# Altium project RP2350_OPCUA_Node.PrjPcb (part 2 of 2)

## Sheet 09_DIGITAL_IO.SchDoc: Схема электрическая принципиальная
size 420 x 297 mm; ApprovedBy: Скрябин; CheckedBy: Скрябин; Author: Корсунов; CompanyName: РТУ МИРЭА; SheetNumber: 9; SheetTotal: 11; PageSetup: Record=PageOptions|CenterHorizontal=True|CenterVertical=True|PrintScale=0.94|XCorrection=1.00|YCorrection=1.00|PrintKind=1|BorderSize=5000000|LeftOffset=0|BottomOffset=0|Orientation=1|PaperLength=1000|PaperWidth=1000|Scale=100|PaperSource=7|PrintQuality=-4|MediaType=1|DitherType=10|PaperKind=A4|PrintScaleMode=1; DecimalNumber: RP23.000001.009 Э3; Name1: Модуль ввода-вывода; lit_A: О; Name2: RP2350 OPC UA
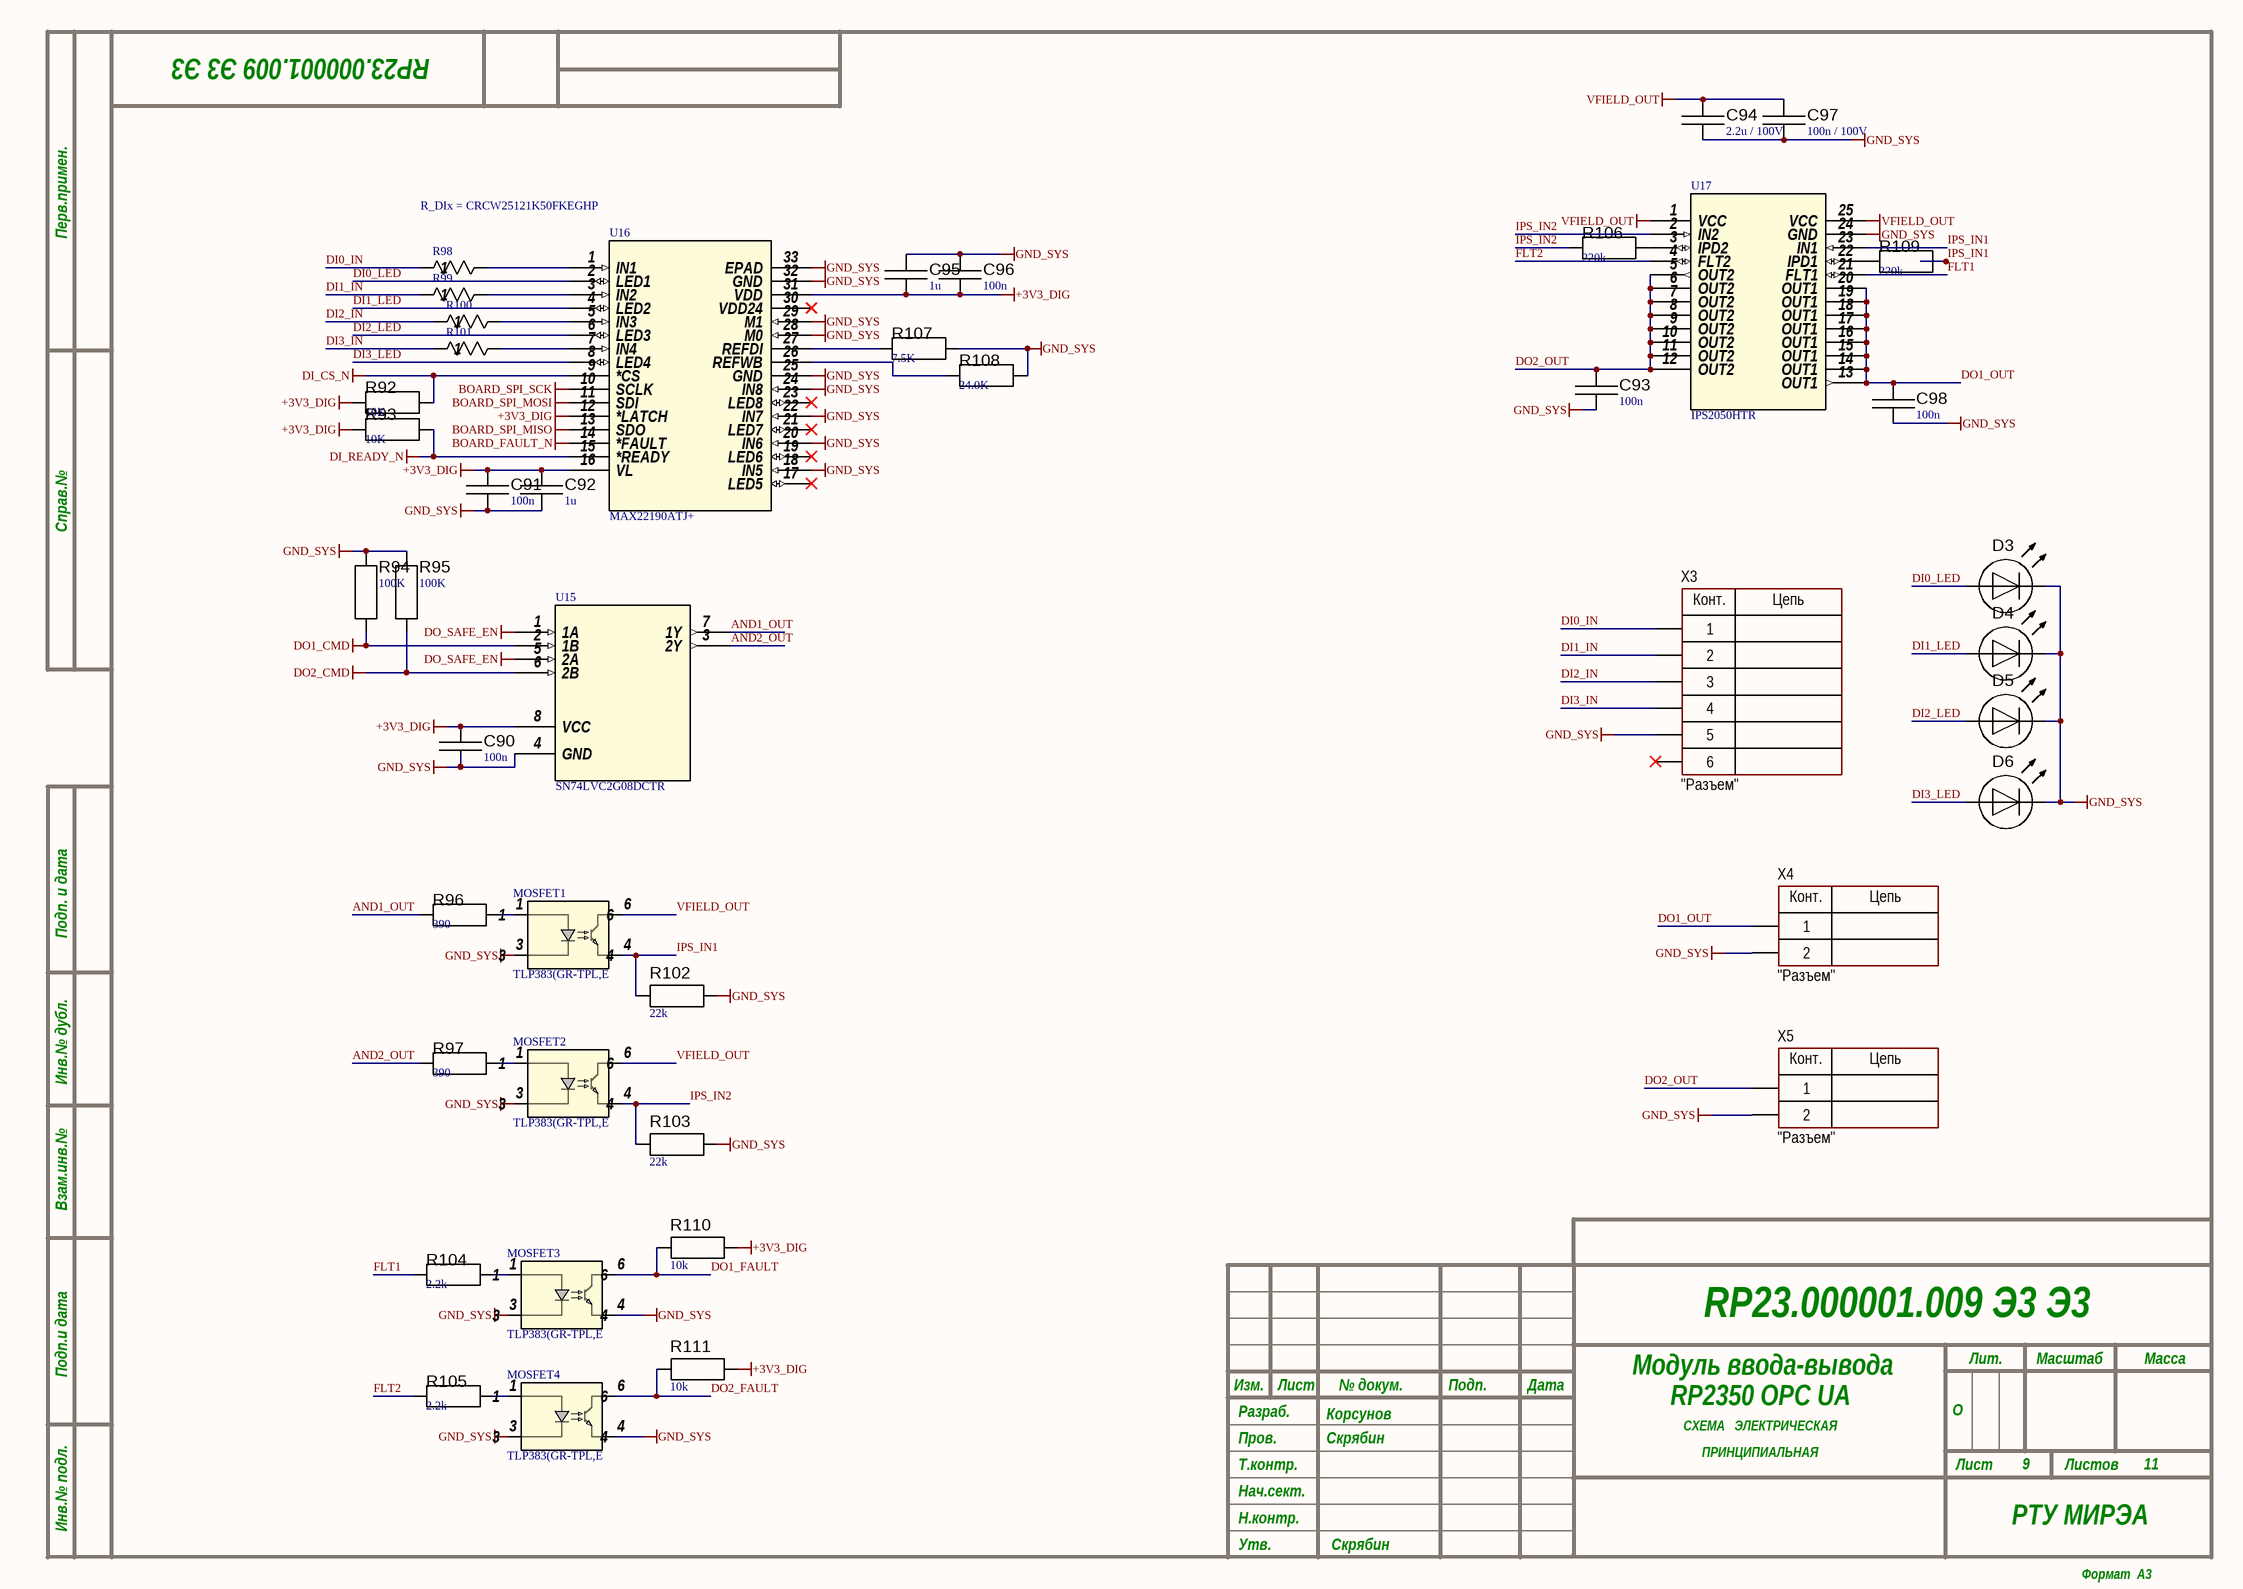
[diagram p8: 09_DIGITAL_IO.SchDoc]

### Parts
C90  value 100n  [C_0603]  (hidden comment: Capacitor)
C91  value 100n  [C_0603]  (hidden comment: Capacitor)
C92  value 1u  [C_0603]  (hidden comment: Capacitor)
C93  value 100n  [C_0603]  (hidden comment: Capacitor)
C94  value 2.2u / 100V  [C_1206]  (hidden comment: Capacitor)
C95  value 1u  [C_0603]  (hidden comment: Capacitor)
C96  value 100n  [C_0603]  (hidden comment: Capacitor)
C97  value 100n / 100V  [C_0603]  (hidden comment: Capacitor)
C98  value 100n  [C_0603]  (hidden comment: Capacitor)
D3  Light-Emitting Diode  [LED_PLCC2_3528]  (value not drawn)
D4  Light-Emitting Diode  [LED_PLCC2_3528]  (value not drawn)
D5  Light-Emitting Diode  [LED_PLCC2_3528]  (value not drawn)
D6  Light-Emitting Diode  [LED_PLCC2_3528]  (value not drawn)
MOSFET1  TLP383(GR-TPL,E  [4pin SO6L_TOS]
MOSFET2  TLP383(GR-TPL,E  [4pin SO6L_TOS]
MOSFET3  TLP383(GR-TPL,E  [4pin SO6L_TOS]
MOSFET4  TLP383(GR-TPL,E  [4pin SO6L_TOS]
R92  value 10K  [R_0603]  (hidden comment: Resistor)
R93  value 10K  [R_0603]  (hidden comment: Resistor)
R94  value 100K  [R_0603]  (hidden comment: Resistor)
R95  value 100K  [R_0603]  (hidden comment: Resistor)
R96  value 390  [R_0603]  (hidden comment: Resistor)
R97  value 390  [R_0603]  (hidden comment: Resistor)
R98  CRCW25121K50FKEGHP  [RES_0FKEGHP_VIS]  (value not drawn)
R99  CRCW25121K50FKEGHP  [RES_0FKEGHP_VIS]  (value not drawn)
R100  CRCW25121K50FKEGHP  [RES_0FKEGHP_VIS]  (value not drawn)
R101  CRCW25121K50FKEGHP  [RES_0FKEGHP_VIS]  (value not drawn)
R102  value 22k  [R_0603]  (hidden comment: Resistor)
R103  value 22k  [R_0603]  (hidden comment: Resistor)
R104  value 2.2k  [R_0603]  (hidden comment: Resistor)
R105  value 2.2k  [R_0603]  (hidden comment: Resistor)
R106  value 220k  [R_0603]  (hidden comment: Resistor)
R107  value 7.5K  [R_0603]  (hidden comment: Resistor)
R108  value 24.0K  [R_0603]  (hidden comment: Resistor)
R109  value 220k  [R_0603]  (hidden comment: Resistor)
R110  value 10k  [R_0603]  (hidden comment: Resistor)
R111  value 10k  [R_0603]  (hidden comment: Resistor)
U15  SN74LVC2G08DCTR  [DCT8]
U16  MAX22190ATJ+  [21-0140L_T3255-5_MXM]
U17  IPS2050HTR  [POWERSSO-24_STM]
X3  CommentText: "Разъем"  [CON: DG350-3.5-06P]
X4  CommentText: "Разъем"  [CON: DG350-3.5-02P]
X5  CommentText: "Разъем"  [CON: DG350-3.5-02P]

### Nets
+3V3_DIG: C90.1 C91.1 C92.1 C95.1 C96.1 R92.1 R93.1 R110.1 R111.1 U15.8(VCC) U16.12(*LATCH) U16.16(VL) U16.31(VDD)
BOARD_FAULT_N: U16.14(*FAULT)
BOARD_SPI_MISO: U16.13(SDO)
BOARD_SPI_MOSI: U16.11(SDI)
BOARD_SPI_SCK: U16.10(SCLK)
DI_CS_N: R92.2 U16.9(*CS)
DI_READY_N: R93.2 U16.15(*READY)
DO1_CMD: R94.1 U15.2(1B)
DO1_FAULT: MOSFET3.6 R110.2
DO2_CMD: R95.1 U15.6(2B)
DO2_FAULT: MOSFET4.6 R111.2
DO_SAFE_EN: U15.1(1A) U15.5(2A)
GND_SYS: C90.2 C91.2 C92.2 C93.1 C94.1 C95.2 C96.2 C97.1 C98.1 D3.2(C) D4.2(C) D5.2(C) D6.2(C) MOSFET1.3 MOSFET2.3 MOSFET3.3 MOSFET3.4 MOSFET4.3 MOSFET4.4 R94.2 R95.2 R102.1 R103.1 R107.2 R108.2 U15.4(GND) U16.18(IN5) U16.20(IN6) U16.22(IN7) U16.24(IN8) U16.25(GND) U16.28(M0) U16.29(M1) U16.32(GND) U16.33(EPAD) U17.24(GND) X3.5 X4.2 X5.2
VFIELD_OUT: C94.2 C97.2 MOSFET1.6 MOSFET2.6 U17.1(VCC) U17.25(VCC)
AND1_OUT: R96.1 U15.7(1Y)
AND2_OUT: R97.1 U15.3(2Y)
DI0_IN: R98.1 X3.1
DI0_LED: D3.1(A) U16.2(LED1)
DI1_IN: R99.1 X3.2
DI1_LED: D4.1(A) U16.4(LED2)
DI2_IN: R100.1 X3.3
DI2_LED: D5.1(A) U16.6(LED3)
DI3_IN: R101.1 X3.4
DI3_LED: D6.1(A) U16.8(LED4)
DO1_OUT: C98.2 U17.13(OUT1) U17.14(OUT1) U17.15(OUT1) U17.16(OUT1) U17.17(OUT1) U17.18(OUT1) U17.19(OUT1) U17.20(OUT1) X4.1
DO2_OUT: C93.2 U17.5(OUT2) U17.6(OUT2) U17.7(OUT2) U17.8(OUT2) U17.9(OUT2) U17.10(OUT2) U17.11(OUT2) U17.12(OUT2) X5.1
FLT1: R104.1 U17.21(FLT1)
FLT2: R105.1 U17.4(FLT2)
IPS_IN1: MOSFET1.4 R102.2 R109.2 U17.23(IN1)
IPS_IN2: MOSFET2.4 R103.2 R106.1 U17.2(IN2)
NetMOSFET1_1: MOSFET1.1 R96.2
NetMOSFET2_1: MOSFET2.1 R97.2
NetMOSFET3_1: MOSFET3.1 R104.2
NetMOSFET4_1: MOSFET4.1 R105.2
NetR98_2: R98.2 U16.1(IN1)
NetR99_2: R99.2 U16.3(IN2)
NetR100_2: R100.2 U16.5(IN3)
NetR101_2: R101.2 U16.7(IN4)
NetR106_2: R106.2 U17.3(IPD2)
NetR107_1: R107.1 U16.27(REFDI)
NetR108_1: R108.1 U16.26(REFWB)
NetR109_1: R109.1 U17.22(IPD1)

Not connected (* = marked no-connect by the designer): U16 17(LED5)* 19(LED6)* 21(LED7)* 23(LED8)* 30(VDD24)*; X3 6*

### Notes on the sheet
- R_DIx = CRCW25121K50FKEGHP
- Перв.примен.
- Справ.№
- Подп. и дата
- Инв.№ дубл.
- Взам.инв.№
- Подп.и дата
- Разраб.
- Изм.
- Лист
- № докум.
- Подп.
- Дата
- Лит.
- Масштаб
- Масса
- Т.контр.
- Пров.
- СХЕМА   ЭЛЕКТРИЧЕСКАЯ
- ПРИНЦИПИАЛЬНАЯ
- Листов
- Инв.№ подл.
- Утв.
- Н.контр.
- Нач.сект.
- Формат  A3
- (in symbol Connector_terminal_2pin) Конт.; Цепь
- (in symbol Connector_terminal_6pin) Конт.; Цепь

### Library data of the parts
C90-C98 = Capacitor: SimulationGenericComponent: True
D3-D6 = LED: AF: 1; BV: 0; BV_MAX: 1e99; EG: 1.11; FC: 0.5; IBV: 0.001; IS: 1e-14; MJSW: 0.33; NTUN: 30; TNOM: 27; XTI: 3; SimulationGenericComponent: True; CJO: 0; CJP: 0; CTA: 0; CTP: 0; FCS: 0.5; FV_MAX: 1e99; IKF: 0; IKR: 0; ISR: 1e-14; JSW: 0; JTUN: 0; JTUNSW: 0; KEG: 1; KF: 0; LEVEL: 1; N: 1; NBV: 1; NR: 1; NS: 1; PHP: 1; RS: 0; TCV: 0; TLEV: 0; TLEVC: 0; TM1: 0; TM2: 0; TPB: 0; TPHP: 0; TRS: 0; TRS2: 0; TT: 0; TTT1: 0; TTT2: 0; VJ: 1; XTITUN: 3
MOSFET1-MOSFET4 = TLP383GR-TPL,E: Photocoupler (phototransistor output), DC input, 5000 Vrms, 4pin SO6L; Manufacturer_Name: Toshiba Electronic Devices & Storage Corp.; Number_devices_in_Package: 1; Copyright: Copyright (C) 2026 Ultra Librarian. All rights reserved.; Manufacturer_Part_Number: TLP383(GR-TPL,E; Datasheet: https://toshiba.semicon-storage.com/info/docget.jsp?did=28830&prodName=TLP383; Source_Package: TLP383; RefDes: Refdes; Type: Type
R92-R97 R102-R111 = Resistor: TC1: 0; SimulationGenericComponent: True; TC2: 0
R98-R101 = CRCW25121K50FKEGHP: CRCW2512-HP 100 1K5 1% E67 E3; Manufacturer_Name: Vishay; Type: Chip Resistor - Surface Mount; Copyright: Copyright (C) 2026 Ultra Librarian. All rights reserved.; Manufacturer_Part_Number: CRCW25121K50FKEGHP; Datasheet: https://www.vishay.com/doc?20043
U15 = SN74LVC2G08DCTR: 2-ch, 2-input 1.65-V to 5.5-V 32 mA drive strength AND gate 8-SSOP -40 to 125; Manufacturer_Name: Texas Instruments; Copyright: Copyright (C) 2026 Ultra Librarian. All rights reserved.; Manufacturer_Part_Number: SN74LVC2G08DCTR; RefDes: RefDes; Type: Type
U16 = MAX22190ATJ+: Octal Industrial Digital Input with Diagnostics; Manufacturer_Name: Analog Devices Inc; Copyright: Copyright (C) 2026 Ultra Librarian. All rights reserved.; Manufacturer_Part_Number: MAX22190ATJ+; RefDes: RefDes; Type: Type
U17 = IPS2050HTR: High efficiency, high-side switch with extended diagnostics and smart driving for capacitive loads; Manufacturer_Name: STMicroelectronics; Copyright: Copyright (C) 2026 Ultra Librarian. All rights reserved.; Manufacturer_Part_Number: IPS2050HTR; Datasheet: https://www.st.com/resource/en/datasheet/ips2050h.pdf; RefDes: RefDes; Type: Type
X3 = Connector_terminal_6pin: Manufacturer: Degson; ValueManufacturerPartNumber: Terminal connector, 6pin, 3.5mm, 300VAC, 10A; PartNumber: DG350-3.5-06P-14; TypeConnector: Terminal connector; VoltageMax: 300VAC; Pitch: 3.5mm; CurrentMax: 10A; Multichannel: 6pin; HelpURL: https://www.compel.ru/infosheet/DEGSON/DG350-3.5-06P-14-00AH
X4 X5 = Connector_terminal_2pin: Manufacturer: Degson; ValueManufacturerPartNumber: Terminal connector, 2pin, 3.5mm, 300VAC, 10A; PartNumber: DG350-3.5-02P-14; TypeConnector: Terminal connector; VoltageMax: 300VAC; Pitch: 3.5mm; CurrentMax: 10A; Multichannel: 2pin; HelpURL: https://www.chipdip.ru/product/dg350-3.5-02p-12

## Sheet 10_UNIVERSAL_INPUTS.SchDoc: Схема электрическая принципиальная
size 420 x 297 mm; ApprovedBy: Скрябин; CheckedBy: Скрябин; Author: Корсунов; CompanyName: РТУ МИРЭА; SheetNumber: 10; SheetTotal: 11; PageSetup: Record=PageOptions|CenterHorizontal=True|CenterVertical=True|PrintScale=0.94|XCorrection=1.00|YCorrection=1.00|PrintKind=1|BorderSize=5000000|LeftOffset=0|BottomOffset=0|Orientation=1|PaperLength=1000|PaperWidth=1000|Scale=100|PaperSource=7|PrintQuality=-4|MediaType=1|DitherType=10|PaperKind=A4|PrintScaleMode=1; DecimalNumber: RP23.000001.010 Э3; Name1: Модуль ввода-вывода; lit_A: О; Name2: RP2350 OPC UA
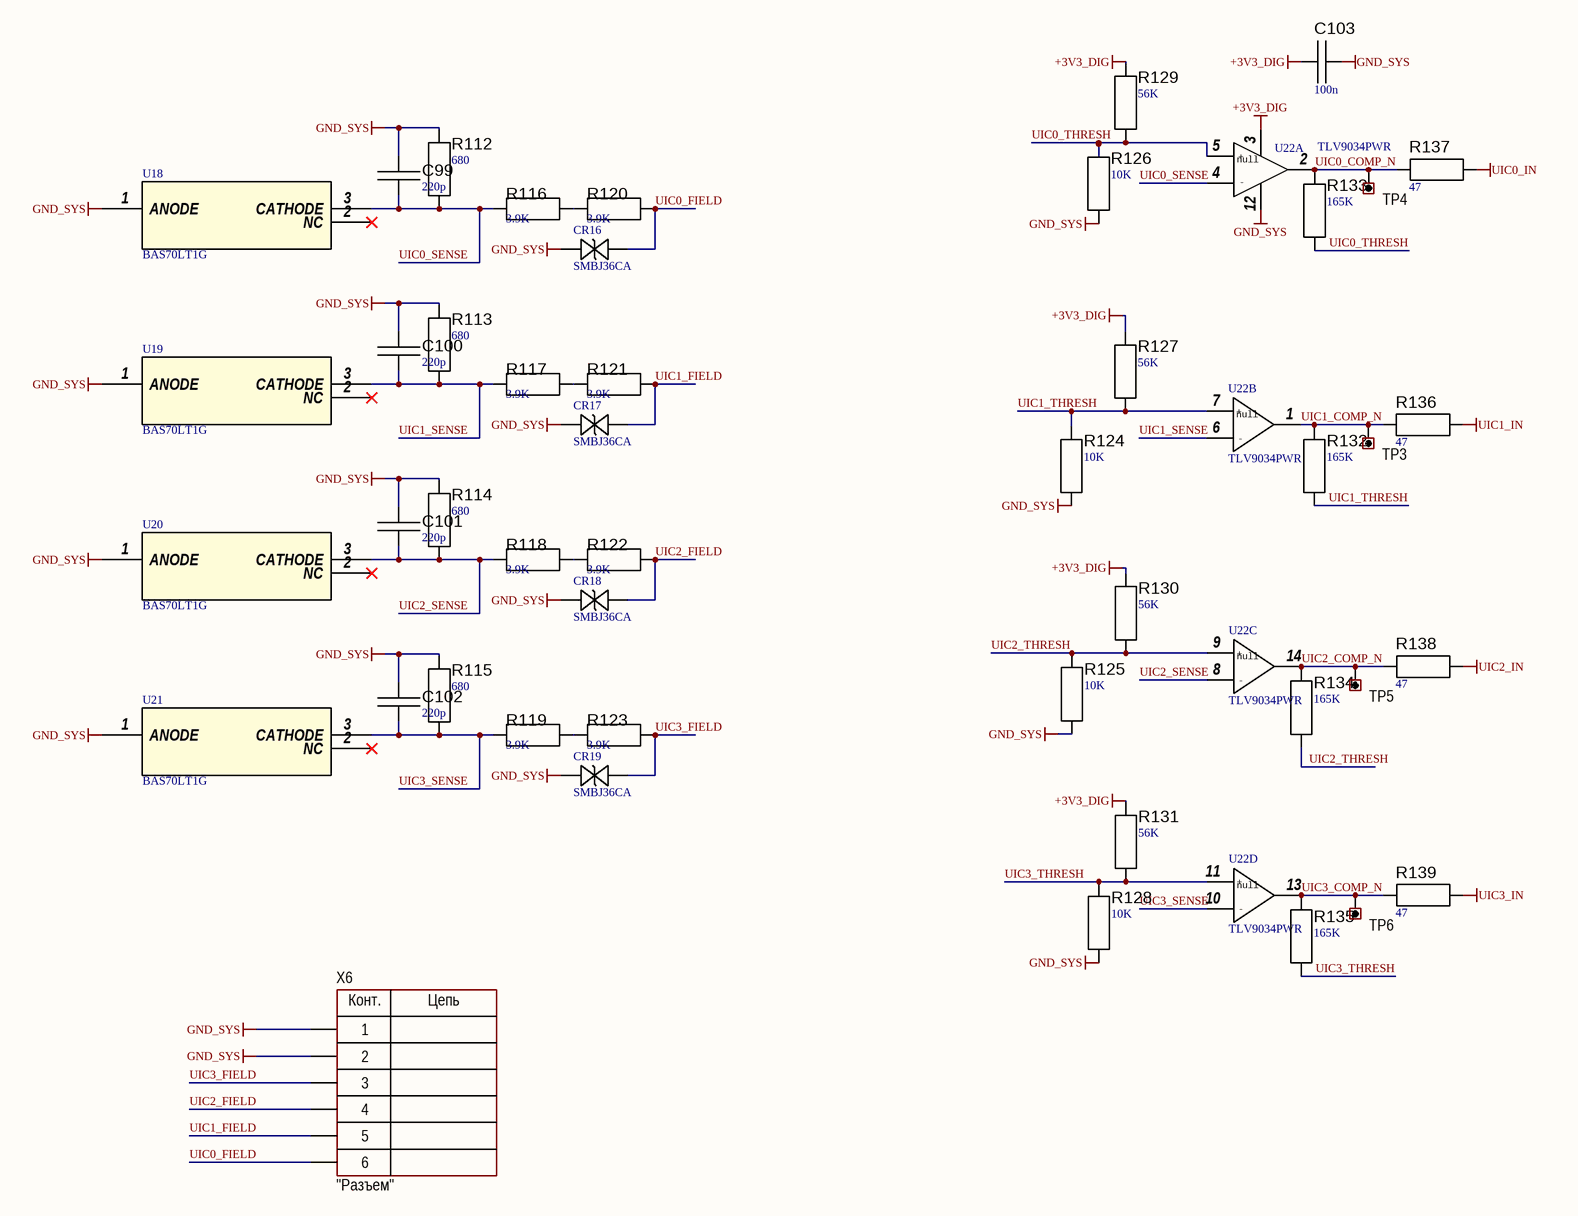
[diagram p9: 10_UNIVERSAL_INPUTS.SchDoc]

### Parts
C99  value 220p  [C_0603]  (hidden comment: Capacitor)
C100  value 220p  [C_0603]  (hidden comment: Capacitor)
C101  value 220p  [C_0603]  (hidden comment: Capacitor)
C102  value 220p  [C_0603]  (hidden comment: Capacitor)
C103  value 100n  [C_0603]  (hidden comment: Capacitor)
CR16  SMBJ36CA  [SMBJSeries_LTF]
CR17  SMBJ36CA  [SMBJSeries_LTF]
CR18  SMBJ36CA  [SMBJSeries_LTF]
CR19  SMBJ36CA  [SMBJSeries_LTF]
R112  value 680  [R_0603]  (hidden comment: Resistor)
R113  value 680  [R_0603]  (hidden comment: Resistor)
R114  value 680  [R_0603]  (hidden comment: Resistor)
R115  value 680  [R_0603]  (hidden comment: Resistor)
R116  value 3.9K  [R_0603]  (hidden comment: Resistor)
R117  value 3.9K  [R_0603]  (hidden comment: Resistor)
R118  value 3.9K  [R_0603]  (hidden comment: Resistor)
R119  value 3.9K  [R_0603]  (hidden comment: Resistor)
R120  value 3.9K  [R_0603]  (hidden comment: Resistor)
R121  value 3.9K  [R_0603]  (hidden comment: Resistor)
R122  value 3.9K  [R_0603]  (hidden comment: Resistor)
R123  value 3.9K  [R_0603]  (hidden comment: Resistor)
R124  value 10K  [R_0603]  (hidden comment: Resistor)
R125  value 10K  [R_0603]  (hidden comment: Resistor)
R126  value 10K  [R_0603]  (hidden comment: Resistor)
R127  value 56K  [R_0603]  (hidden comment: Resistor)
R128  value 10K  [R_0603]  (hidden comment: Resistor)
R129  value 56K  [R_0603]  (hidden comment: Resistor)
R130  value 56K  [R_0603]  (hidden comment: Resistor)
R131  value 56K  [R_0603]  (hidden comment: Resistor)
R132  value 165K  [R_0603]  (hidden comment: Resistor)
R133  value 165K  [R_0603]  (hidden comment: Resistor)
R134  value 165K  [R_0603]  (hidden comment: Resistor)
R135  value 165K  [R_0603]  (hidden comment: Resistor)
R136  value 47  [R_0603]  (hidden comment: Resistor)
R137  value 47  [R_0603]  (hidden comment: Resistor)
R138  value 47  [R_0603]  (hidden comment: Resistor)
R139  value 47  [R_0603]  (hidden comment: Resistor)
TP3  (no value)  [CON: 5000 (Keystone)]
TP4  (no value)  [CON: 5000 (Keystone)]
TP5  (no value)  [CON: 5000 (Keystone)]
TP6  (no value)  [CON: 5000 (Keystone)]
U18  BAS70LT1G  [SOT-23_ONS]
U19  BAS70LT1G  [SOT-23_ONS]
U20  BAS70LT1G  [SOT-23_ONS]
U21  BAS70LT1G  [SOT-23_ONS]
U22  TLV9034PWR  [PW0014A-IPC_A]  (parts A,B,C,D of 4)
X6  CommentText: "Разъем"  [CON: DG350-3.5-06P]

### Nets
+3V3_DIG: C103.2 R127.2 R129.2 R130.2 R131.2 U22.3(V+)
GND_SYS: C99.2 C100.2 C101.2 C102.2 C103.1 CR16.2 CR17.2 CR18.2 CR19.2 R112.2 R113.2 R114.2 R115.2 R124.1 R125.1 R126.1 R128.1 U18.1(ANODE) U19.1(ANODE) U20.1(ANODE) U21.1(ANODE) U22.12(V-) X6.1 X6.2
UIC0_IN: R137.1
UIC1_IN: R136.1
UIC2_IN: R138.1
UIC3_IN: R139.1
UIC0_COMP_N: R133.2 R137.2 TP4.1 U22.2(OUT1)
UIC0_FIELD: CR16.1 R120.2 X6.6
UIC0_SENSE: C99.1 R112.1 R116.1 U18.3(CATHODE) U22.4(IN1-)
UIC0_THRESH: R126.2 R129.1 R133.1 U22.5(IN1+)
UIC1_COMP_N: R132.2 R136.2 TP3.1 U22.1(OUT2)
UIC1_FIELD: CR17.1 R121.2 X6.5
UIC1_SENSE: C100.1 R113.1 R117.1 U19.3(CATHODE) U22.6(IN2-)
UIC1_THRESH: R124.2 R127.1 R132.1 U22.7(IN2+)
UIC2_COMP_N: R134.2 R138.2 TP5.1 U22.14(OUT3)
UIC2_FIELD: CR18.1 R122.2 X6.4
UIC2_SENSE: C101.1 R114.1 R118.1 U20.3(CATHODE) U22.8(IN3-)
UIC2_THRESH: R125.2 R130.1 R134.1 U22.9(IN3+)
UIC3_COMP_N: R135.2 R139.2 TP6.1 U22.13(OUT4)
UIC3_FIELD: CR19.1 R123.2 X6.3
UIC3_SENSE: C102.1 R115.1 R119.1 U21.3(CATHODE) U22.10(IN4-)
UIC3_THRESH: R128.2 R131.1 R135.1 U22.11(IN4+)
NetR116_2: R116.2 R120.1
NetR117_2: R117.2 R121.1
NetR118_2: R118.2 R122.1
NetR119_2: R119.2 R123.1

Not connected (* = marked no-connect by the designer): U18 2(NC)*; U19 2(NC)*; U20 2(NC)*; U21 2(NC)*

### Notes on the sheet
- Перв.примен.
- Справ.№
- Подп. и дата
- Инв.№ дубл.
- Взам.инв.№
- Подп.и дата
- Разраб.
- Изм.
- Лист
- № докум.
- Подп.
- Дата
- Лит.
- Масштаб
- Масса
- Т.контр.
- Пров.
- СХЕМА   ЭЛЕКТРИЧЕСКАЯ
- ПРИНЦИПИАЛЬНАЯ
- Листов
- Инв.№ подл.
- Утв.
- Н.контр.
- Нач.сект.
- Формат  A3
- (in symbol Connector_terminal_6pin) Конт.; Цепь
- (in symbol TLV9034PWR, part A) +; null; -
- (in symbol TLV9034PWR, part B) +; null; -
- (in symbol TLV9034PWR, part C) +; null; -
- (in symbol TLV9034PWR, part D) +; null; -

### Library data of the parts
C99-C103 = Capacitor: SimulationGenericComponent: True
CR16-CR19 = SMBJ36CA: No Description Available; Manufacturer_Name: Littelfuse Inc; Copyright: Copyright (C) 2026 Ultra Librarian. All rights reserved.; Manufacturer_Part_Number: SMBJ36CA
R112-R139 = Resistor: TC1: 0; SimulationGenericComponent: True; TC2: 0
TP3-TP6 = Connector_Test_Point: Manufacturer: Keystone; ValueManufacturerPartNumber: Test point, Keystone, 5001; PartNumber: 5001; TypeConnector: Test point; HelpURL: https://www.digikey.com/product-detail/en/keystone-electronics/5001/36-5001-ND/255327
U18-U21 = BAS70LT1G: No Description Available; Manufacturer_Name: onsemi; Copyright: Copyright (C) 2026 Ultra Librarian. All rights reserved.; Manufacturer_Part_Number: BAS70LT1G; RefDes: RefDes; Type: Type
U22 = TLV9034PWR: High-performance, quad low-voltage push-pull comparator 14-TSSOP -40 to 125; Manufacturer_Name: Texas Instruments; TYPE: TYPE; RefDes: RefDes; Copyright: Copyright (C) 2026 Ultra Librarian. All rights reserved.; Manufacturer_Part_Number: TLV9034PWR; Datasheet: https://www.ti.com/lit/gpn/tlv9034
X6 = Connector_terminal_6pin: Manufacturer: Degson; ValueManufacturerPartNumber: Terminal connector, 6pin, 3.5mm, 300VAC, 10A; PartNumber: DG350-3.5-06P-14; TypeConnector: Terminal connector; VoltageMax: 300VAC; Pitch: 3.5mm; CurrentMax: 10A; Multichannel: 6pin; HelpURL: https://www.compel.ru/infosheet/DEGSON/DG350-3.5-06P-14-00AH

## Sheet 11_LEDS.SchDoc: Схема электрическая принципиальная
size 420 x 297 mm; ApprovedBy: Скрябин; CheckedBy: Скрябин; Author: Корсунов; CompanyName: РТУ МИРЭА; SheetNumber: 11; SheetTotal: 11; PageSetup: Record=PageOptions|CenterHorizontal=True|CenterVertical=True|PrintScale=0.94|XCorrection=1.00|YCorrection=1.00|PrintKind=1|BorderSize=5000000|LeftOffset=0|BottomOffset=0|Orientation=1|PaperLength=1000|PaperWidth=1000|Scale=100|PaperSource=7|PrintQuality=-4|MediaType=1|DitherType=10|PaperKind=A4|PrintScaleMode=1; DecimalNumber: RP23.000001.011 Э3; Name1: Модуль ввода-вывода; lit_A: О; Name2: RP2350 OPC UA
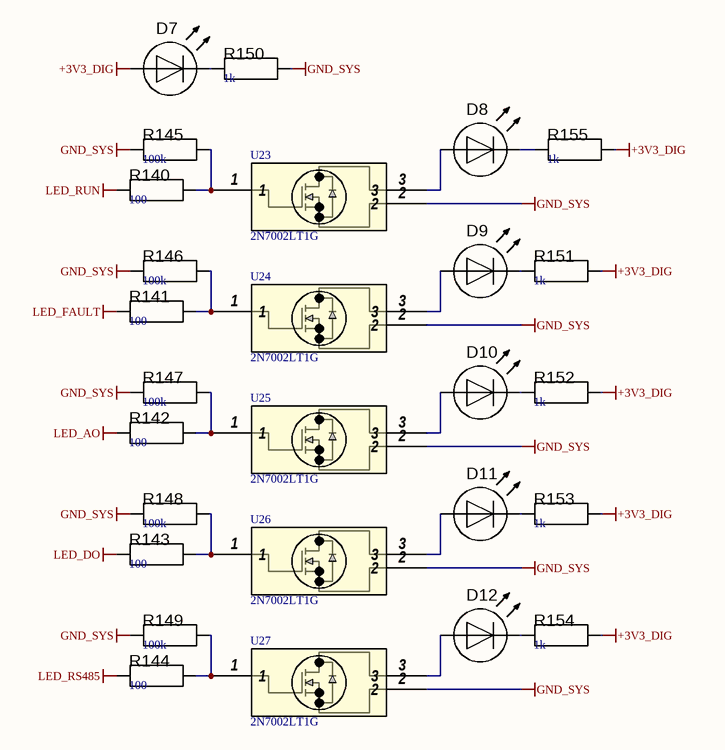
[diagram p10: 11_LEDS.SchDoc]

### Parts
D7  Light-Emitting Diode  [LED_PLCC2_3528]  (value not drawn)
D8  Light-Emitting Diode  [LED_PLCC2_3528]  (value not drawn)
D9  Light-Emitting Diode  [LED_PLCC2_3528]  (value not drawn)
D10  Light-Emitting Diode  [LED_PLCC2_3528]  (value not drawn)
D11  Light-Emitting Diode  [LED_PLCC2_3528]  (value not drawn)
D12  Light-Emitting Diode  [LED_PLCC2_3528]  (value not drawn)
R140  value 100  [R_0603]  (hidden comment: Resistor)
R141  value 100  [R_0603]  (hidden comment: Resistor)
R142  value 100  [R_0603]  (hidden comment: Resistor)
R143  value 100  [R_0603]  (hidden comment: Resistor)
R144  value 100  [R_0603]  (hidden comment: Resistor)
R145  value 100k  [R_0603]  (hidden comment: Resistor)
R146  value 100k  [R_0603]  (hidden comment: Resistor)
R147  value 100k  [R_0603]  (hidden comment: Resistor)
R148  value 100k  [R_0603]  (hidden comment: Resistor)
R149  value 100k  [R_0603]  (hidden comment: Resistor)
R150  value 1k  [R_0603]  (hidden comment: Resistor)
R151  value 1k  [R_0603]  (hidden comment: Resistor)
R152  value 1k  [R_0603]  (hidden comment: Resistor)
R153  value 1k  [R_0603]  (hidden comment: Resistor)
R154  value 1k  [R_0603]  (hidden comment: Resistor)
R155  value 1k  [R_0603]  (hidden comment: Resistor)
U23  2N7002LT1G  [SOT-23_3L_ONS]
U24  2N7002LT1G  [SOT-23_3L_ONS]
U25  2N7002LT1G  [SOT-23_3L_ONS]
U26  2N7002LT1G  [SOT-23_3L_ONS]
U27  2N7002LT1G  [SOT-23_3L_ONS]

### Nets
+3V3_DIG: D7.1(A) R151.2 R152.2 R153.2 R154.2 R155.2
GND_SYS: R145.1 R146.1 R147.1 R148.1 R149.1 R150.2 U23.2 U24.2 U25.2 U26.2 U27.2
LED_AO: R142.1
LED_DO: R143.1
LED_FAULT: R141.1
LED_RS485: R144.1
LED_RUN: R140.1
NetD7_2: D7.2(C) R150.1
NetD8_1: D8.1(A) U23.3
NetD8_2: D8.2(C) R155.1
NetD9_1: D9.1(A) U24.3
NetD9_2: D9.2(C) R151.1
NetD10_1: D10.1(A) U25.3
NetD10_2: D10.2(C) R152.1
NetD11_1: D11.1(A) U26.3
NetD11_2: D11.2(C) R153.1
NetD12_1: D12.1(A) U27.3
NetD12_2: D12.2(C) R154.1
NetR140_2: R140.2 R145.2 U23.1
NetR141_2: R141.2 R146.2 U24.1
NetR142_2: R142.2 R147.2 U25.1
NetR143_2: R143.2 R148.2 U26.1
NetR144_2: R144.2 R149.2 U27.1

### Notes on the sheet
- Перв.примен.
- Справ.№
- Подп. и дата
- Инв.№ дубл.
- Взам.инв.№
- Подп.и дата
- Разраб.
- Изм.
- Лист
- № докум.
- Подп.
- Дата
- Лит.
- Масштаб
- Масса
- Т.контр.
- Пров.
- СХЕМА   ЭЛЕКТРИЧЕСКАЯ
- ПРИНЦИПИАЛЬНАЯ
- Листов
- Инв.№ подл.
- Утв.
- Н.контр.
- Нач.сект.
- Формат  A3

### Library data of the parts
D7-D12 = LED: AF: 1; BV: 0; BV_MAX: 1e99; EG: 1.11; FC: 0.5; IBV: 0.001; IS: 1e-14; MJSW: 0.33; NTUN: 30; TNOM: 27; XTI: 3; SimulationGenericComponent: True; CJO: 0; CJP: 0; CTA: 0; CTP: 0; FCS: 0.5; FV_MAX: 1e99; IKF: 0; IKR: 0; ISR: 1e-14; JSW: 0; JTUN: 0; JTUNSW: 0; KEG: 1; KF: 0; LEVEL: 1; N: 1; NBV: 1; NR: 1; NS: 1; PHP: 1; RS: 0; TCV: 0; TLEV: 0; TLEVC: 0; TM1: 0; TM2: 0; TPB: 0; TPHP: 0; TRS: 0; TRS2: 0; TT: 0; TTT1: 0; TTT2: 0; VJ: 1; XTITUN: 3
R140-R155 = Resistor: TC1: 0; SimulationGenericComponent: True; TC2: 0
U23-U27 = 2N7002LT1G: Description; Manufacturer_Name: onsemi; Copyright: Copyright (C) 2026 Ultra Librarian. All rights reserved.; Manufacturer_Part_Number: 2N7002LT1G; RefDes: RefDes; Type: Type

## Nets that join several sheets
+3V3_ANALOG: 02A_POWER_RAILS (C125.1 U32.5), 03_MCU_RP2350 (C27.2 U3.59)
+3V3_DIG: 01_POWER_INPUT (R3.1), 02A_POWER_RAILS (14 pins), 03_MCU_RP2350 (27 pins), 04_MEMORY (8 pins), 05_ETHERNET_USB (10 pins), 06_RS485 (C55.1 R55.1), 07_ANALOG_INPUTS (5 pins), 08_ANALOG_OUTPUTS (8 pins), 09_DIGITAL_IO (13 pins), 10_UNIVERSAL_INPUTS (6 pins), 11_LEDS (6 pins)
+5V_ANALOG: 02A_POWER_RAILS (C126.1 U33.5), 03_MCU_RP2350 (R25.2), 07_ANALOG_INPUTS (5 pins)
+15V_AO: 02A_POWER_RAILS (5 pins), 03_MCU_RP2350 (R23.2), 08_ANALOG_OUTPUTS (10 pins)
ADC_CS_N: 03_MCU_RP2350 (U3.12), 07_ANALOG_INPUTS (R67.2 U10.38)
ADC_RST_PD_N: 03_MCU_RP2350 (U3.18), 07_ANALOG_INPUTS (R61.2 U10.2)
AGND: 02A_POWER_RAILS (7 pins), 07_ANALOG_INPUTS (31 pins), 08_ANALOG_OUTPUTS (35 pins)
AO_ENABLE_REQ: 02A_POWER_RAILS (R175.1 U31.2), 03_MCU_RP2350 (U3.7)
AO_LATCH: 03_MCU_RP2350 (R16.1 U3.17), 08_ANALOG_OUTPUTS (U12.7 U13.7)
AO_SAFE_EN: 02A_POWER_RAILS (R180.2 R182.1), 08_ANALOG_OUTPUTS (U14.1 U14.3)
BOARD_FAULT_N: 03_MCU_RP2350 (R17.1 U3.19), 08_ANALOG_OUTPUTS (U12.3 U13.3), 09_DIGITAL_IO (U16.14)
BOARD_SPI_MISO: 03_MCU_RP2350 (U3.11), 07_ANALOG_INPUTS (U10.36), 09_DIGITAL_IO (U16.13)
BOARD_SPI_MOSI: 03_MCU_RP2350 (U3.14), 07_ANALOG_INPUTS (U10.1), 08_ANALOG_OUTPUTS (U13.9), 09_DIGITAL_IO (U16.11)
BOARD_SPI_SCK: 03_MCU_RP2350 (U3.13), 07_ANALOG_INPUTS (U10.37), 08_ANALOG_OUTPUTS (U12.8 U13.8), 09_DIGITAL_IO (U16.10)
DI_CS_N: 03_MCU_RP2350 (U3.16), 09_DIGITAL_IO (R92.2 U16.9)
DI_READY_N: 03_MCU_RP2350 (U3.25), 09_DIGITAL_IO (R93.2 U16.15)
DO1_CMD: 03_MCU_RP2350 (U3.20), 09_DIGITAL_IO (R94.1 U15.2)
DO1_FAULT: 03_MCU_RP2350 (U3.22), 09_DIGITAL_IO (MOSFET3.6 R110.2)
DO2_CMD: 03_MCU_RP2350 (U3.21), 09_DIGITAL_IO (R95.1 U15.6)
DO2_FAULT: 03_MCU_RP2350 (U3.23), 09_DIGITAL_IO (MOSFET4.6 R111.2)
DO_ENABLE_REQ: 02A_POWER_RAILS (R176.1 U31.6), 03_MCU_RP2350 (U3.8)
DO_SAFE_EN: 02A_POWER_RAILS (R181.2 R183.2), 09_DIGITAL_IO (U15.1 U15.5)
ETH_CS_N: 03_MCU_RP2350 (U3.2), 05_ETHERNET_USB (R32.2 U6.32)
ETH_INT_N: 03_MCU_RP2350 (U3.6), 05_ETHERNET_USB (U6.36)
ETH_MISO: 03_MCU_RP2350 (U3.1), 05_ETHERNET_USB (U6.34)
ETH_MOSI: 03_MCU_RP2350 (U3.4), 05_ETHERNET_USB (U6.35)
ETH_SCK: 03_MCU_RP2350 (U3.3), 05_ETHERNET_USB (U6.33)
GND_SYS: 01_POWER_INPUT (9 pins), 02A_POWER_RAILS (54 pins), 03_MCU_RP2350 (27 pins), 04_MEMORY (6 pins), 05_ETHERNET_USB (31 pins), 06_RS485 (5 pins), 08_ANALOG_OUTPUTS (U14.2), 09_DIGITAL_IO (39 pins), 10_UNIVERSAL_INPUTS (24 pins), 11_LEDS (11 pins)
LED_AO: 03_MCU_RP2350 (U3.38), 11_LEDS (R142.1)
LED_DO: 03_MCU_RP2350 (U3.39), 11_LEDS (R143.1)
LED_FAULT: 03_MCU_RP2350 (U3.37), 11_LEDS (R141.1)
LED_RS485: 03_MCU_RP2350 (U3.40), 11_LEDS (R144.1)
LED_RUN: 03_MCU_RP2350 (U3.36), 11_LEDS (R140.1)
PSRAM_CS_N: 03_MCU_RP2350 (U3.77), 04_MEMORY (R30.1)
PWR_3V3_PGOOD_N: 02A_POWER_RAILS (R160.2 U29.4), 03_MCU_RP2350 (U3.43)
PWR_5V_PGOOD_N: 02A_POWER_RAILS (R164.2 U30.16), 03_MCU_RP2350 (U3.44)
PWR_IN_FAULT_N: 01_POWER_INPUT (R2.1), 03_MCU_RP2350 (R15.1 U3.9)
QSPI_SCLK: 03_MCU_RP2350 (U3.71), 04_MEMORY (U4.B2 U5.6)
QSPI_SD0: 03_MCU_RP2350 (U3.72), 04_MEMORY (U4.D3 U5.5)
QSPI_SD1: 03_MCU_RP2350 (U3.74), 04_MEMORY (U4.D2 U5.2)
QSPI_SD2: 03_MCU_RP2350 (U3.73), 04_MEMORY (U4.C4 U5.3)
QSPI_SD3: 03_MCU_RP2350 (U3.70), 04_MEMORY (U4.D4 U5.7)
QSPI_SS: 03_MCU_RP2350 (U3.75), 04_MEMORY (R28.2 SW1.1 U4.C2)
RS485_DE_RE: 03_MCU_RP2350 (U3.47), 06_RS485 (R54.1 U8.3 U8.5)
RS485_RX: 03_MCU_RP2350 (U3.46), 06_RS485 (U8.4)
RS485_TX: 03_MCU_RP2350 (U3.45), 06_RS485 (U8.2)
SYS_RESET_N: 02A_POWER_RAILS (5 pins), 03_MCU_RP2350 (U3.35), 05_ETHERNET_USB (U6.37)
UIC0_IN: 03_MCU_RP2350 (U3.49), 10_UNIVERSAL_INPUTS (R137.1)
UIC1_IN: 03_MCU_RP2350 (U3.52), 10_UNIVERSAL_INPUTS (R136.1)
UIC2_IN: 03_MCU_RP2350 (U3.53), 10_UNIVERSAL_INPUTS (R138.1)
UIC3_IN: 03_MCU_RP2350 (U3.54), 10_UNIVERSAL_INPUTS (R139.1)
USB_DM: 03_MCU_RP2350 (R18.2), 05_ETHERNET_USB (J1.A7 J1.B7 U7.2)
USB_DP: 03_MCU_RP2350 (R19.2), 05_ETHERNET_USB (J1.A6 J1.B6 U7.1)
USB_VBUS_DET: 03_MCU_RP2350 (U3.78), 05_ETHERNET_USB (R42.1 R43.2)
VFIELD_OUT: 01_POWER_INPUT (CR3.2), 09_DIGITAL_IO (6 pins)
VIN_PROTECTED: 01_POWER_INPUT (5 pins), 02A_POWER_RAILS (12 pins), 03_MCU_RP2350 (R21.2)
WD_ENABLE: 02A_POWER_RAILS (R159.1 U28.5), 03_MCU_RP2350 (U3.80)
WD_KICK: 02A_POWER_RAILS (R167.1 U28.6), 03_MCU_RP2350 (U3.79)